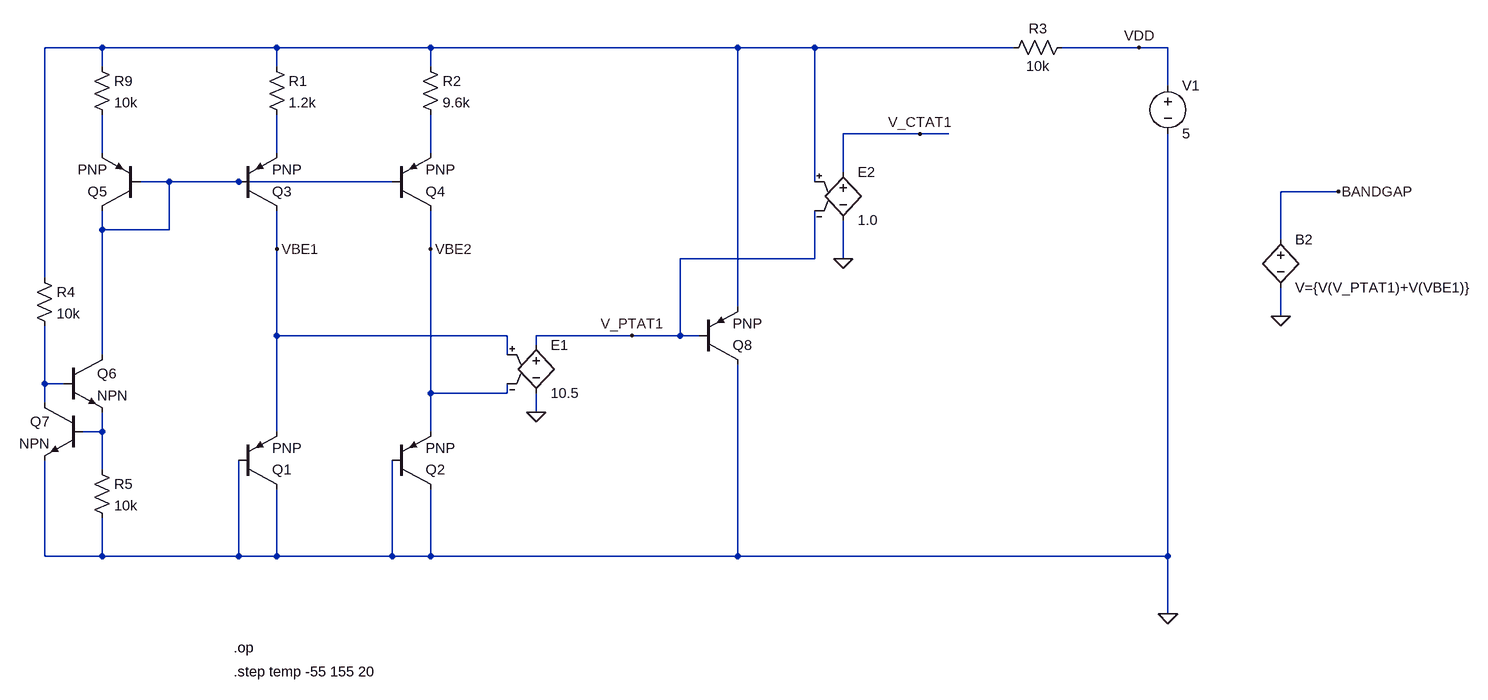
[diagram p0: schematic Bandgap_Reference.asc]
Bandgap_Reference.asc, the LTspice schematic file:
Version 4.1
SHEET 1 3480 1028
WIRE -240 -224 -336 -224
WIRE 208 -224 -240 -224
WIRE 464 -224 208 -224
WIRE 976 -224 464 -224
WIRE 1104 -224 976 -224
WIRE 2048 -224 1104 -224
WIRE 2880 -224 2128 -224
WIRE 2928 -224 2880 -224
WIRE -240 -192 -240 -224
WIRE 208 -192 208 -224
WIRE 464 -192 464 -224
WIRE 2928 -160 2928 -224
WIRE 1280 -80 1152 -80
WIRE 1328 -80 1280 -80
WIRE -240 -48 -240 -112
WIRE 208 -48 208 -112
WIRE 464 -48 464 -112
WIRE 1152 -16 1152 -80
WIRE -128 0 -176 0
WIRE 144 0 -128 0
WIRE 400 0 144 0
WIRE 1104 0 1104 -224
WIRE 3232 16 3136 16
WIRE -240 80 -240 48
WIRE -128 80 -128 0
WIRE -128 80 -240 80
WIRE 3136 96 3136 16
WIRE 208 112 208 48
WIRE 464 112 464 48
WIRE 1104 128 1104 48
WIRE 1104 128 880 128
WIRE 1152 128 1152 64
WIRE -336 160 -336 -224
WIRE 976 208 976 -224
WIRE 3136 224 3136 176
WIRE 208 256 208 112
WIRE 592 256 208 256
WIRE 800 256 640 256
WIRE 880 256 880 128
WIRE 880 256 800 256
WIRE 912 256 880 256
WIRE 640 272 640 256
WIRE -240 288 -240 80
WIRE 592 288 592 256
WIRE -336 336 -336 240
WIRE -304 336 -336 336
WIRE 464 352 464 112
WIRE 592 352 592 336
WIRE 592 352 464 352
WIRE -336 368 -336 336
WIRE 640 384 640 352
WIRE -240 416 -240 384
WIRE -240 416 -272 416
WIRE 208 416 208 256
WIRE 464 416 464 352
WIRE -240 480 -240 416
WIRE -336 624 -336 464
WIRE -240 624 -240 560
WIRE -240 624 -336 624
WIRE 144 624 144 464
WIRE 144 624 -240 624
WIRE 208 624 208 512
WIRE 208 624 144 624
WIRE 400 624 400 464
WIRE 400 624 208 624
WIRE 464 624 464 512
WIRE 464 624 400 624
WIRE 976 624 976 304
WIRE 976 624 464 624
WIRE 2928 624 2928 -80
WIRE 2928 624 976 624
WIRE 2928 720 2928 624
FLAG 208 112 VBE1
FLAG 464 112 VBE2
FLAG 2880 -224 VDD
FLAG 2928 720 0
FLAG 3136 224 0
FLAG 3232 16 BANDGAP
FLAG 800 256 V_PTAT1
FLAG 640 384 0
FLAG 1152 128 0
FLAG 1280 -80 V_CTAT1
SYMBOL voltage 2928 -176 R0
WINDOW 123 0 0 Left 0
WINDOW 39 0 0 Left 0
SYMATTR InstName V1
SYMATTR Value 5
SYMBOL pnp 144 512 M180
SYMATTR InstName Q1
SYMBOL pnp 400 512 M180
SYMATTR InstName Q2
SYMBOL pnp 144 48 M180
SYMATTR InstName Q3
SYMBOL pnp 400 48 M180
SYMATTR InstName Q4
SYMBOL res 192 -208 R0
SYMATTR InstName R1
SYMATTR Value 1.2k
SYMBOL res 448 -208 R0
SYMATTR InstName R2
SYMATTR Value 9.6k
SYMBOL bv 3136 80 R0
SYMATTR InstName B2
SYMATTR Value V={V(V_PTAT1)+V(VBE1)}
SYMBOL pnp -176 48 R180
SYMATTR InstName Q5
SYMBOL npn -304 288 R0
SYMATTR InstName Q6
SYMBOL npn -272 368 M0
SYMATTR InstName Q7
SYMBOL res -352 144 R0
SYMATTR InstName R4
SYMATTR Value 10k
SYMBOL res -256 464 R0
SYMATTR InstName R5
SYMATTR Value 10k
SYMBOL res -256 -208 R0
SYMATTR InstName R9
SYMATTR Value 10k
SYMBOL e 640 256 R0
SYMATTR InstName E1
SYMATTR Value 10.5
SYMBOL pnp 912 304 M180
SYMATTR InstName Q8
SYMBOL e 1152 -32 R0
SYMATTR InstName E2
SYMATTR Value 1.0
SYMBOL res 2144 -240 R90
WINDOW 0 0 56 VBottom 2
WINDOW 3 32 56 VTop 2
SYMATTR InstName R3
SYMATTR Value 10k
TEXT 136 816 Left 2 !.step temp -55 155 20
TEXT 136 776 Left 2 !.op

The netlist it stands for:
* Bandgap_Reference.asc
V1 VDD 0 5
Q1 0 0 VBE1 0 PNP
Q2 0 0 VBE2 0 PNP
Q3 VBE1 N005 N003 0 PNP
Q4 VBE2 N005 N004 0 PNP
R1 N001 N003 1.2k
R2 N001 N004 9.6k
B2 BANDGAP 0 V={V(V_PTAT1)+V(VBE1)}
Q5 N005 N005 N002 0 PNP
Q6 N005 N006 N007 0 NPN
Q7 N006 N007 0 0 NPN
R4 N001 N006 10k
R5 N007 0 10k
R9 N001 N002 10k
E1 V_PTAT1 0 VBE1 VBE2 10.5
Q8 0 V_PTAT1 N001 0 PNP
E2 V_CTAT1 0 N001 V_PTAT1 1.0
R3 VDD N001 10k
.model NPN NPN
.model PNP PNP
.lib standard.bjt
.step temp -55 155 20
.op
.backanno
.end